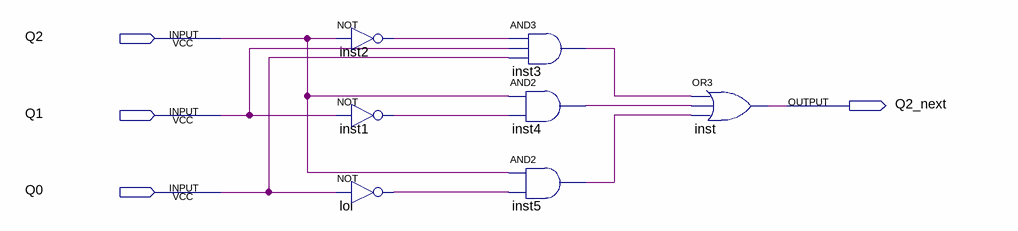
[diagram p0: schematic sheet]
// Quartus schematic Q2_next.bdf as structural Verilog: 7 symbols, 4 pins
module Q2_next (
  input  Q2,
  input  Q1,
  input  Q0,
  output Q2_next
);

  wire inst1_out, inst2_out, inst3_out, inst4_out, inst5_out, lol_out;

  not inst2 (inst2_out, Q2);
  not inst1 (inst1_out, Q1);
  not lol (lol_out, Q0);
  and inst3 (inst3_out, inst2_out, Q1, Q0);
  and inst4 (inst4_out, Q2, inst1_out);
  and inst5 (inst5_out, Q2, lol_out);
  or inst (Q2_next, inst3_out, inst4_out, inst5_out);
endmodule
